# Altium schematic sheet BWSMA-KE-P001.schdoc
size 127 x 101 mm
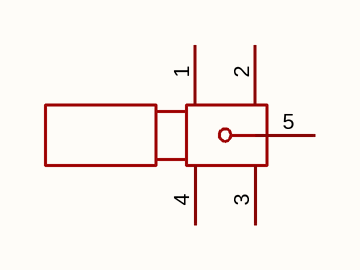
[diagram p0: BWSMA-KE-P001.schdoc]

## Parts
RF?  bwsma-ke-p001  [SMA-SMD_BWSMA-KE-P001]  (value not drawn)

## Nets

Not connected (* = marked no-connect by the designer): RF? 1 2 3 4 5

## Library data of the parts
RF? = bwsma-ke-p001: 连接器类型:板端;接口类型:内孔;端口数量:1;接口直径:5.2mm;接口长度/高度:-;频率:-;射频系列:SMA;阻抗:50Ω;样式:偏脚;工作温度:-;; Manufacturer: BAT WIRELESS(蝙蝠无线); AddInBom: yes; ModelId: 45bafb7576014fe1be3aebd244b0ca8e; ModelName: SMA-TH_5P-L6.5-W6.5-H9.5_BWSMA-KE-P001; ModelTransform: 255.905,255.905,0,180,0,90,-23.62,0,17.717; Connector Type: 板端; Interface: 内孔; Number of Ports: 1; Interface Diameter: 5.2mm; RF Series: SMA; Impedance: 50Ω; Style: 偏脚; Symbol: BWSMA-KE-P001; LCSC Part Name: 内孔 SMA 偏脚; SupplierPart: C496550; ManufacturerPart: BWSMA-KE-P001; Supplier Footprint: SMD; JLCPCB Part Class: Extended Part; Datasheet: https://item.szlcsc.com/datasheet/BWSMA-KE-P001/508499.html; Supplier: LCSC; ConvertToPcb: yes; FootprintName: SMA-SMD_BWSMA-KE-P001; Interface Length/Height: -; Value: -; Operating Temperature Range: -